# Altium schematic sheet Ethernet.SchDoc
size A3
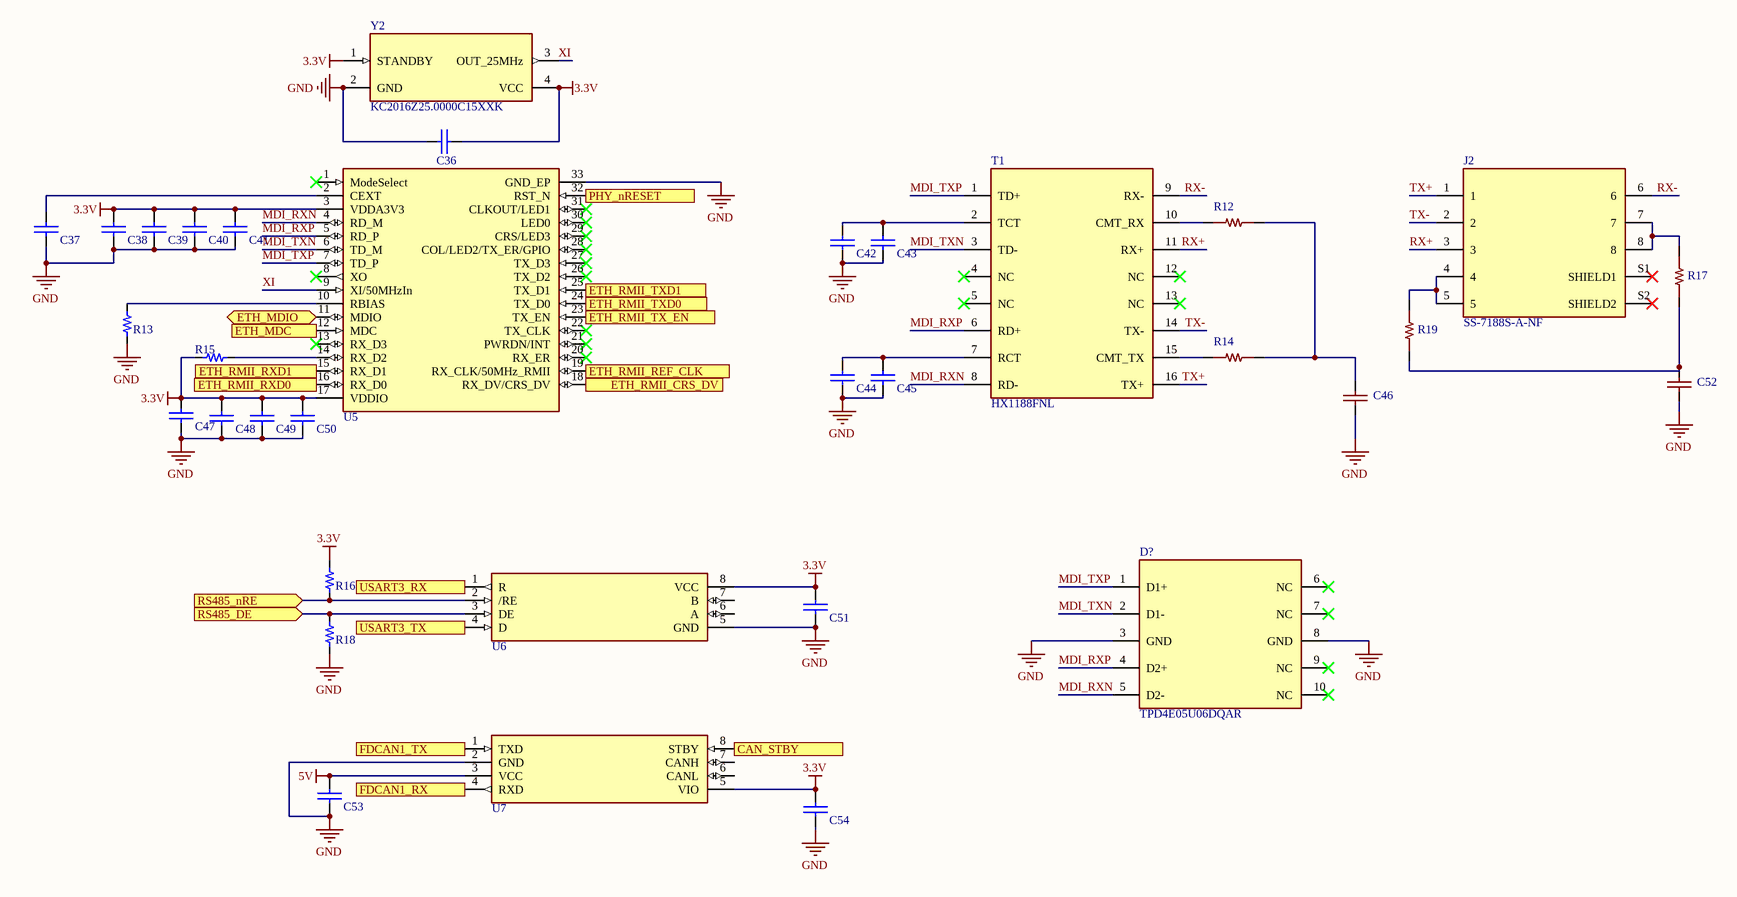
[diagram p0: Ethernet.SchDoc]

## Parts
C36  10 nF  [GW_CAND_0603_cap]  (value not drawn)
C37  2 nF  [GW_CAND_0603_cap]  (value not drawn)
C38  10 nF  [GW_CAND_0603_cap]  (value not drawn)
C39  100 nF  [GW_CAND_0603_cap]  (value not drawn)
C40  1 uF  [GW_CAND_0603_cap]  (value not drawn)
C41  10 uF  [GW_CAND_0805_cap]  (value not drawn)
C42  100 nF  [GW_CAND_0603_cap]  (value not drawn)
C43  100 nF  [GW_CAND_0603_cap]  (value not drawn)
C44  100 nF  [GW_CAND_0603_cap]  (value not drawn)
C45  100 nF  [GW_CAND_0603_cap]  (value not drawn)
C46  C1206C102KGRACAUTO  [GW_C1206_KEMET_C1076_DENSITY_B]  (value not drawn)
C47  10 nF  [GW_CAND_0603_cap]  (value not drawn)
C48  100 nF  [GW_CAND_0603_cap]  (value not drawn)
C49  1 uF  [GW_CAND_0603_cap]  (value not drawn)
C50  10 uF  [GW_CAND_0805_cap]  (value not drawn)
C51  100 nF  [GW_CAND_0603_cap]  (value not drawn)
C52  C1206C102KGRACAUTO  [GW_C1206_KEMET_C1076_DENSITY_B]  (value not drawn)
C53  100 nF  [GW_CAND_0603_cap]  (value not drawn)
C54  100 nF  [GW_CAND_0603_cap]  (value not drawn)
D?  TPD4E05U06DQAR  [GW_DQA0010A_TI]
J2  SS-7188S-A-NF  [GW_SS7188SANF_STEWART]
R12  CRCW080575R0FKEA  [GW_CRCW0805_VISHAY_20035_REFLOW]  (value not drawn)
R13  6.49 kOhm  [GW_CAND_0603_res]  (value not drawn)
R14  CRCW080575R0FKEA  [GW_CRCW0805_VISHAY_20035_REFLOW]  (value not drawn)
R15  2.49 kOhm  [GW_CAND_0603_res]  (value not drawn)
R16  10 kOhm  [GW_CAND_0603_res]  (value not drawn)
R17  CRCW080575R0FKEA  [GW_CRCW0805_VISHAY_20035_REFLOW]  (value not drawn)
R18  10 kOhm  [GW_CAND_0603_res]  (value not drawn)
R19  CRCW080575R0FKEA  [GW_CRCW0805_VISHAY_20035_REFLOW]  (value not drawn)
T1  HX1188FNL  [GW_HX1188FNL_PULSE]
U5  DP83826IRHBR  [GW_RHB0032M_TI]  (value not drawn)
U6  THVD1420DR  [GW_SOIC8_1P27_5P4]  (value not drawn)
U7  ATA6561-GAQW  [GW_SOIC8_1P27_5P4]  (value not drawn)
Y2  KC2016Z25.0000C15XXK  [GW_KC2016Z_KYOCERA]

## Ports
CAN_STBY (in), ETH_MDC (in), ETH_MDIO (bidir), ETH_RMII_CRS_DV (out), ETH_RMII_REF_CLK (out), ETH_RMII_RXD0 (out), ETH_RMII_RXD1 (out), ETH_RMII_TX_EN (in), ETH_RMII_TXD0 (in), ETH_RMII_TXD1 (in), FDCAN1_RX (out), FDCAN1_TX (in), PHY_nRESET (in), RS485_DE (in), RS485_nRE (in), USART3_RX (out), USART3_TX (in)

## Nets
3.3V: C36.2 C38.1 C39.1 C40.1 C41.1 C47.1 C48.1 C49.1 C50.1 C51.1 C54.1 R15.1 R16.2 U5.3(VDDA3V3) U5.17(VDDIO) U6.8(VCC) U7.5(VIO) Y2.1(STANDBY) Y2.4(VCC)
5V: C53.1 U7.3(VCC)
GND: C36.1 C37.2 C38.2 C39.2 C40.2 C41.2 C42.2 C43.2 C44.2 C45.2 C46.1 C47.2 C48.2 C49.2 C50.2 C51.2 C52.1 C53.2 C54.2 D?.3(GND) D?.8(GND) R13.1 R18.1 U5.33(GND_EP) U6.5(GND) U7.2(GND) Y2.2(GND)
CAN_STBY: U7.8(STBY) ; port CAN_STBY
ETH_MDC: U5.12(MDC) ; port ETH_MDC
ETH_MDIO: U5.11(MDIO) ; port ETH_MDIO
ETH_RMII_CRS_DV: U5.18(RX_DV/CRS_DV) ; port ETH_RMII_CRS_DV
ETH_RMII_REF_CLK: U5.19(RX_CLK/50MHz_RMII) ; port ETH_RMII_REF_CLK
ETH_RMII_RXD0: U5.16(RX_D0) ; port ETH_RMII_RXD0
ETH_RMII_RXD1: U5.15(RX_D1) ; port ETH_RMII_RXD1
ETH_RMII_TX_EN: U5.23(TX_EN) ; port ETH_RMII_TX_EN
ETH_RMII_TXD0: U5.24(TX_D0) ; port ETH_RMII_TXD0
ETH_RMII_TXD1: U5.25(TX_D1) ; port ETH_RMII_TXD1
FDCAN1_RX: U7.4(RXD) ; port FDCAN1_RX
FDCAN1_TX: U7.1(TXD) ; port FDCAN1_TX
MDI_RXN: D?.5(D2-) T1.8(RD-) U5.4(RD_M)
MDI_RXP: D?.4(D2+) T1.6(RD+) U5.5(RD_P)
MDI_TXN: D?.2(D1-) T1.3(TD-) U5.6(TD_M)
MDI_TXP: D?.1(D1+) T1.1(TD+) U5.7(TD_P)
PHY_nRESET: U5.32(RST_N) ; port PHY_nRESET
RS485_DE: R18.2 U6.3(DE) ; port RS485_DE
RS485_nRE: R16.1 U6.2(/RE) ; port RS485_nRE
RX+: J2.3 T1.11(RX+)
RX-: J2.6 T1.9(RX-)
TX+: J2.1 T1.16(TX+)
TX-: J2.2 T1.14(TX-)
USART3_RX: U6.1(R) ; port USART3_RX
USART3_TX: U6.4(D) ; port USART3_TX
XI: U5.9(XI/50MHzIn) Y2.3(OUT_25MHz)
NetC37_1: C37.1 U5.2(CEXT)
NetC42_1: C42.1 C43.1 T1.2(TCT)
NetC44_1: C44.1 C45.1 T1.7(RCT)
NetC46_2: C46.2 R12.2 R14.2
NetC52_2: C52.2 R17.2 R19.1
NetJ2_4: J2.4 J2.5 R19.2
NetJ2_7: J2.7 J2.8 R17.1
NetR12_1: R12.1 T1.10(CMT_RX)
NetR13_2: R13.2 U5.10(RBIAS)
NetR14_1: R14.1 T1.15(CMT_TX)
NetR15_2: R15.2 U5.14(RX_D2)

Not connected (* = marked no-connect by the designer): D? 6(NC)* 7(NC)* 9(NC)* 10(NC)*; J2 S1(SHIELD1)* S2(SHIELD2)*; T1 4(NC)* 5(NC)* 12(NC)* 13(NC)*; U5 1(ModeSelect)* 8(XO)* 13(RX_D3)* 20(RX_ER)* 21(PWRDN/INT)* 22(TX_CLK)* 26(TX_D2)* 27(TX_D3)* 28(COL/LED2/TX_ER/GPIO)* 29(CRS/LED3)* 30(LED0)* 31(CLKOUT/LED1)*; U6 6(A) 7(B); U7 6(CANL) 7(CANH)

## Library data of the parts
C36 C38 C47 = GW_C0603C103K1RACTU_97f3ee33: C0603C103K1RACTU; 10 nF; 100 V; X7R; -55..125 C; CAD_CANDIDATE; Manufacturer: KEMET; Tolerance: 10%; Electrical_Status: PROVISIONAL; CAD_Source: Professor_shared.SchLib glyph Cap_0.1uF_0603_50V; CAD_Limitations: Glyph pins/types inspected; exact manufacturer land-pattern/mask/paste qualification pending.; Electrical_Notes: Ficha KEMET local DI_CIN p1; no confundir con externo CL10B103KA8WPNC 25 V. Modelo candidato existente; sin cotejo visual de pads/pines en Altium.; Manufacturer Part Number: C0603C103K1RACTU; Value: 10 nF; Rating: 100 V; X7R; -55..125 C; Power Rating: N/A; Package: 0603; CAD_Status: CAD_CANDIDATE
C37 = GW_C0603C202J5GACTU_fa733a70: C0603C202J5GACTU; 2 nF; 50 V; C0G; CAD_CANDIDATE; Manufacturer: KEMET; Tolerance: 5% seleccion; Electrical_Status: PROVISIONAL; CAD_Source: Professor_shared.SchLib glyph Cap_0.1uF_0603_50V; CAD_Limitations: Glyph pins/types inspected; exact manufacturer land-pattern/mask/paste qualification pending.; Electrical_Notes: Conflicto EVM C57=100 nF; prevalece requisito actual 2 nF, no copiar C57. Modelo candidato existente; sin cotejo visual de pads/pines en Altium.; Manufacturer Part Number: C0603C202J5GACTU; Value: 2 nF; Rating: 50 V; C0G; Power Rating: N/A; Package: 0603; CAD_Status: CAD_CANDIDATE
C39 C42-C45 C48 C51 C53 C54 = GW_C0603C104K5RACTU_dc5e12a5: C0603C104K5RACTU; 100 nF; 50 V; X7R; -55..125 C; CAD_CANDIDATE; Manufacturer: KEMET; Tolerance: 10%; Electrical_Status: PROVISIONAL; CAD_Source: Professor_shared.SchLib glyph Cap_0.1uF_0603_50V; CAD_Limitations: Glyph pins/types inspected; exact manufacturer land-pattern/mask/paste qualification pending.; Electrical_Notes: Ficha KEMET local p1. Adaptar parametros; no usar el Y5V 0603F104Z500CT como equivalente. Modelo candidato existente; sin cotejo visual de pads/pines en Altium.; Manufacturer Part Number: C0603C104K5RACTU; Value: 100 nF; Rating: 50 V; X7R; -55..125 C; Power Rating: N/A; Package: 0603; CAD_Status: CAD_CANDIDATE
C40 C49 = GW_CL10A105KB8NNNC_c3932faa: CL10A105KB8NNNC; 1 uF; 50 V; X5R; -55..85 C; CAD_CANDIDATE; Manufacturer: Samsung Electro-Mechanics; Tolerance: 10%; Electrical_Status: PROVISIONAL; CAD_Source: Professor_shared.SchLib glyph Cap_1uF_0603_50V; CAD_Limitations: Glyph pins/types inspected; exact manufacturer land-pattern/mask/paste qualification pending.; Electrical_Notes: Samsung ficha oficial; Ceff/ESR pendientes por aplicacion. Limite X5R 85 C: no homologado para ambiente superior. Modelo candidato existente; sin cotejo visual de pads/pines en Altium.; Manufacturer Part Number: CL10A105KB8NNNC; Value: 1 uF; Rating: 50 V; X5R; -55..85 C; Power Rating: N/A; Package: 0603; CAD_Status: CAD_CANDIDATE
C41 C50 = GW_CL21A106KAYNNNE_c6e24382: CL21A106KAYNNNE; 10 uF; 25 V; X5R; -55..85 C; CAD_CANDIDATE; Manufacturer: Samsung Electro-Mechanics; Tolerance: 10%; Electrical_Status: PROVISIONAL; CAD_Source: Professor_shared.SchLib glyph Cap_10uF_0805_25V_; CAD_Limitations: Glyph pins/types inspected; exact manufacturer land-pattern/mask/paste qualification pending.; Electrical_Notes: Ceff a 3.3 V y temperatura pendientes. No usar para entrada 30 V. Modelo candidato existente; sin cotejo visual de pads/pines en Altium.; Manufacturer Part Number: CL21A106KAYNNNE; Value: 10 uF; Rating: 25 V; X5R; -55..85 C; Power Rating: N/A; Package: 0805; CAD_Status: CAD_CANDIDATE
C46 C52 = C1206C102KGRACAUTO: KEMET1nF10%2kVDCX7R1206; Ethernet chassis AC return; no safety-Y or surge claim; Manufacturer: KEMET; Value: 1 nF; Tolerance: 10%; Voltage Rating: 2000 VDC; Dielectric: X7R; CAD Status: CAD_VERIFIED; Electrical Approval: PROVISIONAL_APPLICATION; not safety-Y certified; Electrical Test: NOT_TESTED; Assembly: JLC Extended observed2026-11-07; quantity unknown; no stock reservation; Manufacturer Part Number: C1206C102KGRACAUTO; Package: 1206 /3216; Datasheet: sources/ethernet_1nf/C600002.pdf; Source: KEMET C1076_X7R_HV_AUTO_SMD9/10/2019 pp1-2 ordering/rating,p4 body,p10 Table3 densityB1206; C600002 exact catalog identity; LCSC Part Number: C600002; Terminal Mapping: Nonpolar, project1-left/2-right; symbol1->pad1,2->pad2
D? = TPD4E05U06DQAR: TI SLVSBO7O table4-2 p4; DQA0010A 4220328/A board/stencil pp29-30; PHY-side only, per DP83826EVM sheet3. GND3/8 to logic GND. NC6/7/9/10 may be pass-through pads; preserve isolation.; Manufacturer: Texas Instruments; CAD Status: CAD_CANDIDATE; Manufacturer Part Number: TPD4E05U06DQAR; Source: TI SLVSBO7O table4-2 p4; DQA0010A 4220328/A board/stencil pp29-30; Limitations: PHY-side only, per DP83826EVM sheet3. GND3/8 to logic GND. NC6/7/9/10 may be pass-through pads; preserve isolation.
J2 = SS-7188S-A-NF: Cinch/Stewart CT710001 revB0 10-Jul-2023 component-side recommended hole layout; Numbered contacts per component-side drawing. S1/S2 are project labels for unnumbered shield tabs; MP1/2 are non-electrical mounting holes. Candidate copper lands; sourcing risk separate.; CAD Status: CAD_CANDIDATE; Manufacturer: Cinch / Stewart; Manufacturer Part Number: SS-7188S-A-NF; Source: Cinch/Stewart CT710001 revB0 10-Jul-2023 component-side recommended hole layout; Limitations: Numbered contacts per component-side drawing. S1/S2 are project labels for unnumbered shield tabs; MP1/2 are non-electrical mounting holes. Candidate copper lands; sourcing risk separate.
R12 R14 R17 R19 = CRCW080575R0FKEA: 75Ohm1%0.125W0805 Vishay D/CRCW e3; Ethernet cable termination; not C-suffix commodity variant; Value: 75 Ohm; Tolerance: 1%; Power Rating: 0.125 W at70C; derating applies; TCR: 100 ppm/K; Local Datasheet: sources/ethernet_75ohm/C844859.pdf; CAD Status: CAD_VERIFIED; Design Approval: RETAINED_ORIGINAL_SELECTION; Electrical Test: NOT_TESTED; Assembly: JLC Extended observed; quantity unknown; verify before ordering; Manufacturer: Vishay; Manufacturer Part Number: CRCW080575R0FKEA; Package: 0805 /2012; Datasheet: https://www.vishay.com/docs/20035/dcrcwe3.pdf; Source: Vishay20035 Rev18-Jun-2018 p3 ordering, p9 body/reflow lands; JLC C844859 exact identity observed2026-11-07; LCSC Part Number: C844859; Terminal Mapping: Nonpolar resistor: project pin1=left pad1,pin2=right pad2
R13 = GW_RC0603FR-076K49L_f42a9329: RC0603FR-076K49L; 6.49 kOhm; 75 V max; limite sqrt(P*R); CAD_CANDIDATE; Manufacturer: Yageo; Tolerance: 1%; Power Rating: 0.1 W @70 C; Electrical_Status: PROVISIONAL; CAD_Source: Professor_shared.SchLib glyph Res_10k_0603_1/10W; CAD_Limitations: Glyph pins/types inspected; exact manufacturer land-pattern/mask/paste qualification pending.; Electrical_Notes: P<3.3^2/6490=1.68 mW; actualizacion de valor/MPN sobre simbolo generico pendiente. Modelo candidato existente; sin cotejo visual de pads/pines en Altium.; Manufacturer Part Number: RC0603FR-076K49L; Value: 6.49 kOhm; Rating: 75 V max; limite sqrt(P*R); Package: 0603; CAD_Status: CAD_CANDIDATE
R15 = GW_RC0603FR-072K49L_b905c5f0: RC0603FR-072K49L; 2.49 kOhm; 75 V max; limite sqrt(P*R); CAD_CANDIDATE; Manufacturer: Yageo; Tolerance: 1%; Power Rating: 0.1 W @70 C; Electrical_Status: PROVISIONAL; CAD_Source: Professor_shared.SchLib glyph Res_10k_0603_1/10W; CAD_Limitations: Glyph pins/types inspected; exact manufacturer land-pattern/mask/paste qualification pending.; Electrical_Notes: Candidato ENHANCED/RMII leader: ModeSelect NC, strap1=1 default, strap8=1, strap5=0 default. Ver tabla del informe; sin LEDs de straps. Modelo candidato existente; sin cotejo visual de pads/pines en Altium.; Manufacturer Part Number: RC0603FR-072K49L; Value: 2.49 kOhm; Rating: 75 V max; limite sqrt(P*R); Package: 0603; CAD_Status: CAD_CANDIDATE
R16 R18 = GW_FRC0603J103TS_7289f91d: FRC0603J103TS; 10 kOhm; >= 3.3 V; tension de trabajo por verificar; CAD_CANDIDATE; Manufacturer: FOJAN; Tolerance: 5%; Power Rating: 0.1 W; Electrical_Status: PROVISIONAL; CAD_Source: Professor_shared.SchLib glyph Res_10k_0603_1/10W; CAD_Limitations: Glyph pins/types inspected; exact manufacturer land-pattern/mask/paste qualification pending.; Electrical_Notes: Ratings transcritos del CAD; falta ficha FOJAN. Alternativa RC0603FR-0710KL con ficha oficial local, mismo footprint candidato. Modelo candidato existente; sin cotejo visual de pads/pines en Altium.; Manufacturer Part Number: FRC0603J103TS; Value: 10 kOhm; Rating: >= 3.3 V; tension de trabajo por verificar; Package: 0603; CAD_Status: CAD_CANDIDATE
T1 = HX1188FNL: Pulse HX1188FNL revB 30-May-2014 sheets2-3 PS-2005.002-D; Use exact winding map; NC4,5,12,13 remain unconnected. FNLT is packaging variant; selected MPN FNL.; Manufacturer: Pulse Electronics; CAD Status: CAD_CANDIDATE; Manufacturer Part Number: HX1188FNL; Source: Pulse HX1188FNL revB 30-May-2014 sheets2-3 PS-2005.002-D; Limitations: Use exact winding map; NC4,5,12,13 remain unconnected. FNLT is packaging variant; selected MPN FNL.
U5 = DP83826IRHBR: DP83826IRHBR; CAD_CANDIDATE; Multi-function strap pins conservatively bidirectional. Mode not frozen. EP33 must be soldered to ground; thermal vias are board-level optional, filled/plugged/tented if under paste.; Manufacturer: Texas Instruments; Electrical_Status: PROVISIONAL; CAD_Source: SNLS647I table5-1 pp5-6; exposed pad p7; RHB0032M 4223725/A PDF pp111-113; Manufacturer Part Number: DP83826IRHBR; Value: DP83826IRHBR; CAD_Status: CAD_CANDIDATE; CAD_Limitations: Multi-function strap pins conservatively bidirectional. Mode not frozen. EP33 must be soldered to ground; thermal vias are board-level optional, filled/plugged/tented if under paste.
U6 = THVD1420DR: THVD1420DR; CAD_CANDIDATE;; Manufacturer: Texas Instruments; Electrical_Status: PROVISIONAL; CAD_Source: SLLSF78B table4-1 p3; D0008A 4214825/C PDF pp30-32; CAD_Limitations: Circuit not electrically released.; Manufacturer Part Number: THVD1420DR; Value: THVD1420DR; CAD_Status: CAD_CANDIDATE
U7 = ATA6561-GAQW: ATA6561-GAQW; CAD_CANDIDATE;; Manufacturer: Microchip; Electrical_Status: PROVISIONAL; CAD_Source: DS20005991B pin table p3; C04-2057-OA RevE p19; CAD_Limitations: Circuit not electrically released.; Manufacturer Part Number: ATA6561-GAQW; Value: ATA6561-GAQW; CAD_Status: CAD_CANDIDATE
Y2 = KC2016Z25.0000C15XXK: Kyocera TNY1T-H1-DEX01-11 17-Jul-2026 pp4,6 table2 fig4; Two independent oscillators proposed; 10nF per supply. Tie1 to3V3. Load<=15pF and PHY phase-noise qualification pending.; CAD Status: CAD_CANDIDATE; Manufacturer: Kyocera; Manufacturer Part Number: KC2016Z25.0000C15XXK; Source: Kyocera TNY1T-H1-DEX01-11 17-Jul-2026 pp4,6 table2 fig4; Limitations: Two independent oscillators proposed; 10nF per supply. Tie1 to3V3. Load<=15pF and PHY phase-noise qualification pending.